# Altium schematic sheet Tx_PSU.SchDoc
size A4; Date: *******; ApprovedBy: *******; CheckedBy: None; Author: *******; CompanyName: *******; DrawnBy: Name; Engineer: *******; Organization: *******; Address1: *******; Address2: *******; Address3: *******; Address4: *******; DocumentNumber: Doc Num; Revision: *******; SheetNumber: 4; SheetTotal: 8; CurrentTime: *******; CurrentDate: *******; Time: *******; DocumentFullPathAndName: *******; DocumentName: *******; ModifiedDate: *******; ImagePath: *******; ProjectName: *******; Application_BuildNumber: *******
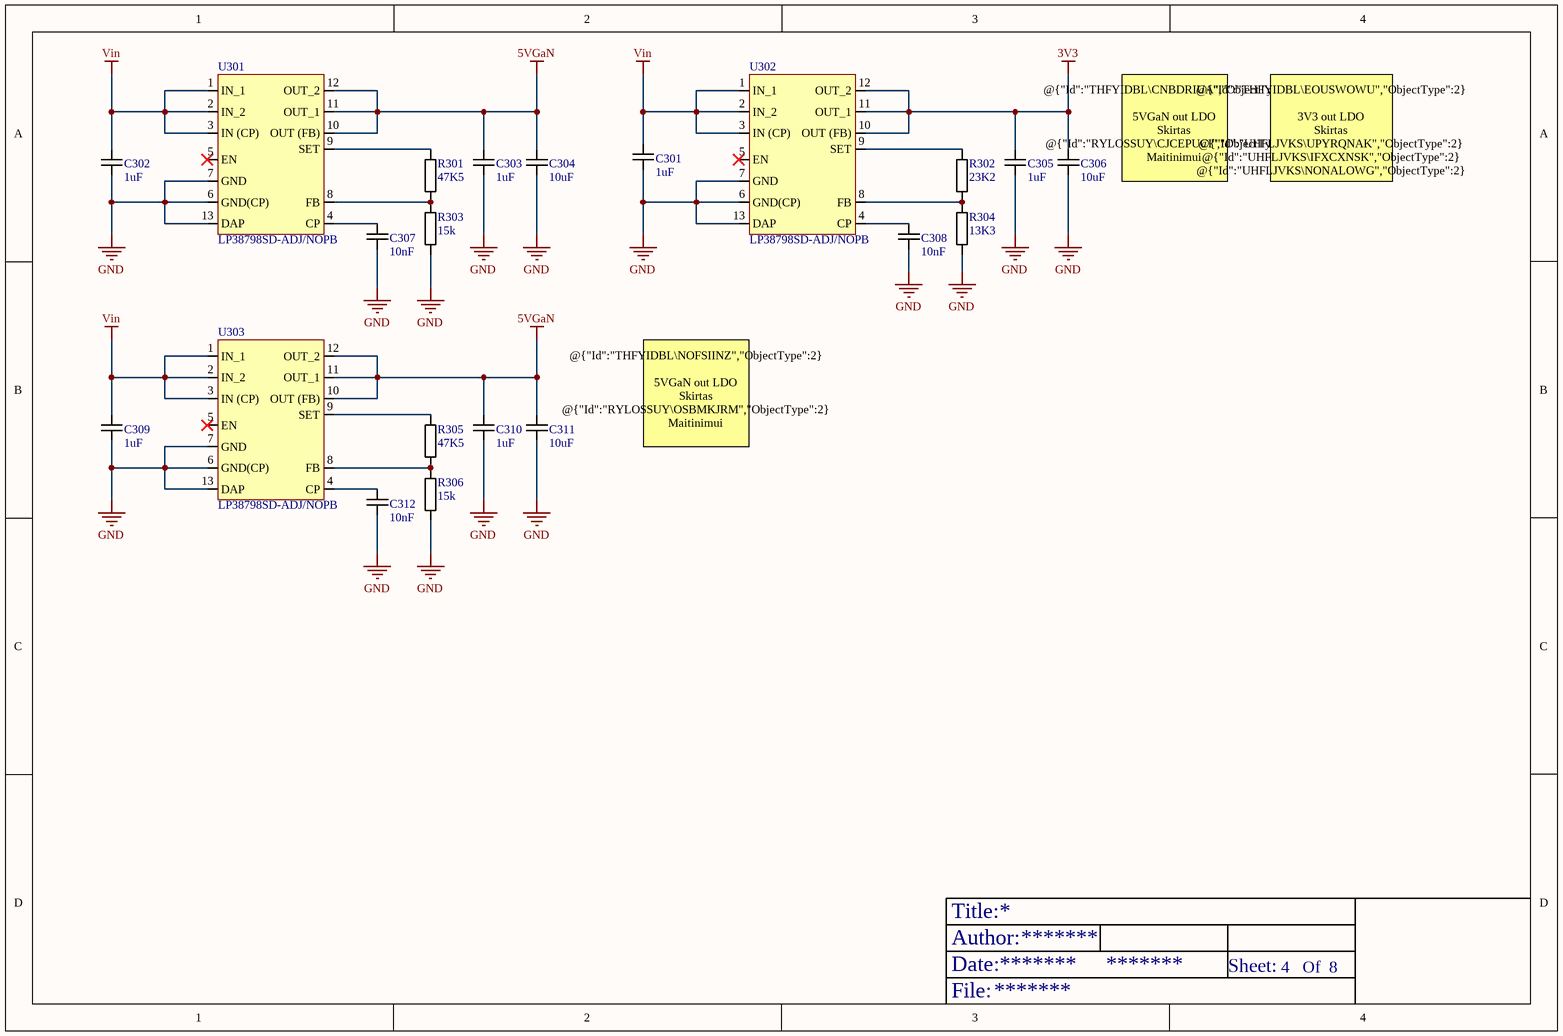
[diagram p0: Tx_PSU.SchDoc]

## Parts
C301  1uF  [1uF 0603]
C302  1uF  [1uF 0603]
C303  1uF  [1uF 0603]
C304  10uF  [10uF 0805]
C305  1uF  [1uF 0603]
C306  10uF  [10uF 0805]
C307  10nF  [10nF 0402]
C308  10nF  [10nF 0402]
C309  1uF  [1uF 0603]
C310  1uF  [1uF 0603]
C311  10uF  [10uF 0805]
C312  10nF  [10nF 0402]
R301  47K5  [47.5k 0402]
R302  23K2  [23.2k 0402]
R303  15k  [15k 0402]
R304  13K3  [13k3 0402]
R305  47K5  [47.5k 0402]
R306  15k  [15k 0402]
U301  LP38798SD-ADJ/NOPB  [LP38798SD-ADJ/NOPB]
U302  LP38798SD-ADJ/NOPB  [LP38798SD-ADJ/NOPB]
U303  LP38798SD-ADJ/NOPB  [LP38798SD-ADJ/NOPB]

## Nets
3V3: C305.2 C306.2 U302.10(OUT_(FB)) U302.11(OUT_1) U302.12(OUT_2)
5VGaN: C303.2 C304.2 C310.2 C311.2 U301.10(OUT_(FB)) U301.11(OUT_1) U301.12(OUT_2) U303.10(OUT_(FB)) U303.11(OUT_1) U303.12(OUT_2)
GND: C301.1 C302.1 C303.1 C304.1 C305.1 C306.1 C307.1 C308.1 C309.1 C310.1 C311.1 C312.1 R303.1 R304.1 R306.1 U301.6(GND(CP)) U301.7(GND) U301.13(DAP) U302.6(GND(CP)) U302.7(GND) U302.13(DAP) U303.6(GND(CP)) U303.7(GND) U303.13(DAP)
Vin: C301.2 C302.2 C309.2 U301.1(IN_1) U301.2(IN_2) U301.3(IN_(CP)) U302.1(IN_1) U302.2(IN_2) U302.3(IN_(CP)) U303.1(IN_1) U303.2(IN_2) U303.3(IN_(CP))
NetC307_2: C307.2 U301.4(CP)
NetC308_2: C308.2 U302.4(CP)
NetC312_2: C312.2 U303.4(CP)
NetR301_1: R301.1 R303.2 U301.8(FB)
NetR301_2: R301.2 U301.9(SET)
NetR302_1: R302.1 U302.9(SET)
NetR302_2: R302.2 R304.2 U302.8(FB)
NetR305_1: R305.1 R306.2 U303.8(FB)
NetR305_2: R305.2 U303.9(SET)

Not connected (* = marked no-connect by the designer): U301 5(EN)*; U302 5(EN)*; U303 5(EN)*

## Notes on the sheet
- (near C306) @{"Id":"THFYIDBL\CNBDRIUA","ObjectType":2}
  5VGaN out LDO
  Skirtas @{"Id":"RYLOSSUY\CJCEPUCI","ObjectType":2}
  Maitinimui
- @{"Id":"THFYIDBL\EOUSWOWU","ObjectType":2}
  3V3 out LDO
  Skirtas
  @{"Id":"UHFLJVKS\UPYRQNAK","ObjectType":2} @{"Id":"UHFLJVKS\IFXCXNSK","ObjectType":2} @{"Id":"UHFLJVKS\NONALOWG","ObjectType":2}
  Maitinimui
- @{"Id":"THFYIDBL\NOFSIINZ","ObjectType":2}
  5VGaN out LDO
  Skirtas @{"Id":"RYLOSSUY\OSBMKJRM","ObjectType":2}
  Maitinimui
- Title:
- Date:
- Author:
- Sheet:
- Of
- File:

## Library data of the parts
C301-C303 C305 C309 C310 = 1uF 0603: CGA3E1X7R1E105K080AC
C304 C306 C311 = 10uF 0805: GRJ21BR61E106KE01K
C307 C308 C312 = 10nF 0402: C0402C103J5RACTU
R301 R305 = 47K5 0402: CR0402-FX-4752GLF
R302 = 23K2 0402: CR0402-FX-2322GLF
R303 R306 = 15k 0402: CRCW040215K0FKED
R304 = 13K3 0402: CRCW040213K3FKED
U301-U303 = LP38798SD-ADJ/NOPB: input 3-20V output 1.5-5V